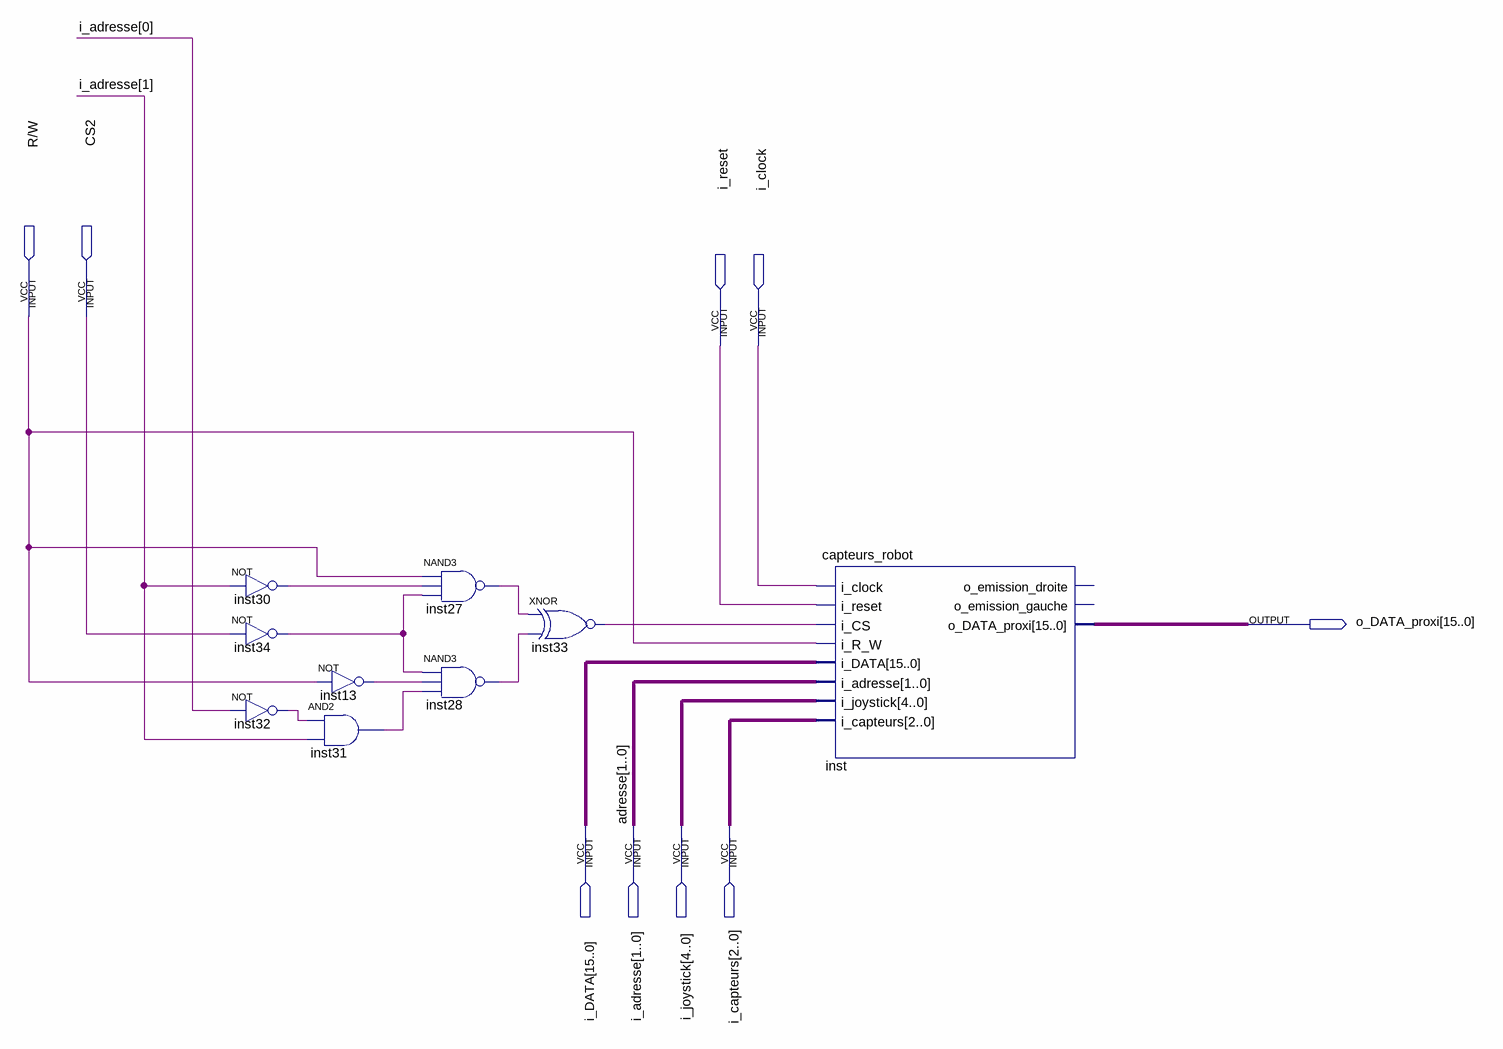
[diagram p0: schematic sheet]
// Quartus schematic CAPTEURS_CMD_ROBOT.bdf as structural Verilog: 9 symbols, 9 pins
module CAPTEURS_CMD_ROBOT (
  input  \R/W ,
  input  CS2,
  input  i_reset,
  input  i_clock,
  input  [15:0] i_DATA,
  input  [1:0] i_adresse,
  input  [4:0] i_joystick,
  input  [2:0] i_capteurs,
  output [15:0] o_DATA_proxi
);

  wire inst13_out, inst27_out, inst28_out, inst30_out, inst31_out, inst32_out, inst33_out, inst34_out;

  not inst30 (inst30_out, i_adresse[1]);
  not inst34 (inst34_out, CS2);
  not inst32 (inst32_out, i_adresse[0]);
  not inst13 (inst13_out, \R/W );
  and inst31 (inst31_out, inst32_out, i_adresse[1]);
  nand inst27 (inst27_out, \R/W , inst30_out, inst34_out);
  nand inst28 (inst28_out, inst34_out, inst13_out, inst31_out);
  xnor inst33 (inst33_out, inst27_out, inst28_out);
  capteurs_robot inst (
    .i_clock(i_clock), .i_reset(i_reset), .i_CS(inst33_out), .i_R_W(\R/W ), .i_DATA(i_DATA),
    .i_adresse(i_adresse), .i_joystick(i_joystick), .i_capteurs(i_capteurs), .o_DATA_proxi(o_DATA_proxi));  // open: o_emission_droite, o_emission_gauche

  // Other names for the same wires on the sheet: adresse[1:0] = i_adresse
endmodule
